# Altium schematic sheet Turret_Logic.SchDoc: PCB Projet Guimbarde Logic
size Letter; ApprovedBy: APPROUVÉ PAR; Author: Alexandre Dionne; Organization: Cegep Limoilou; Address1: 1300, 8e Avenue; Address2: Québec, QC; Address3: Canada; Address4: G1J 5L5; Revision: A; SheetNumber: 3; SheetTotal: 3
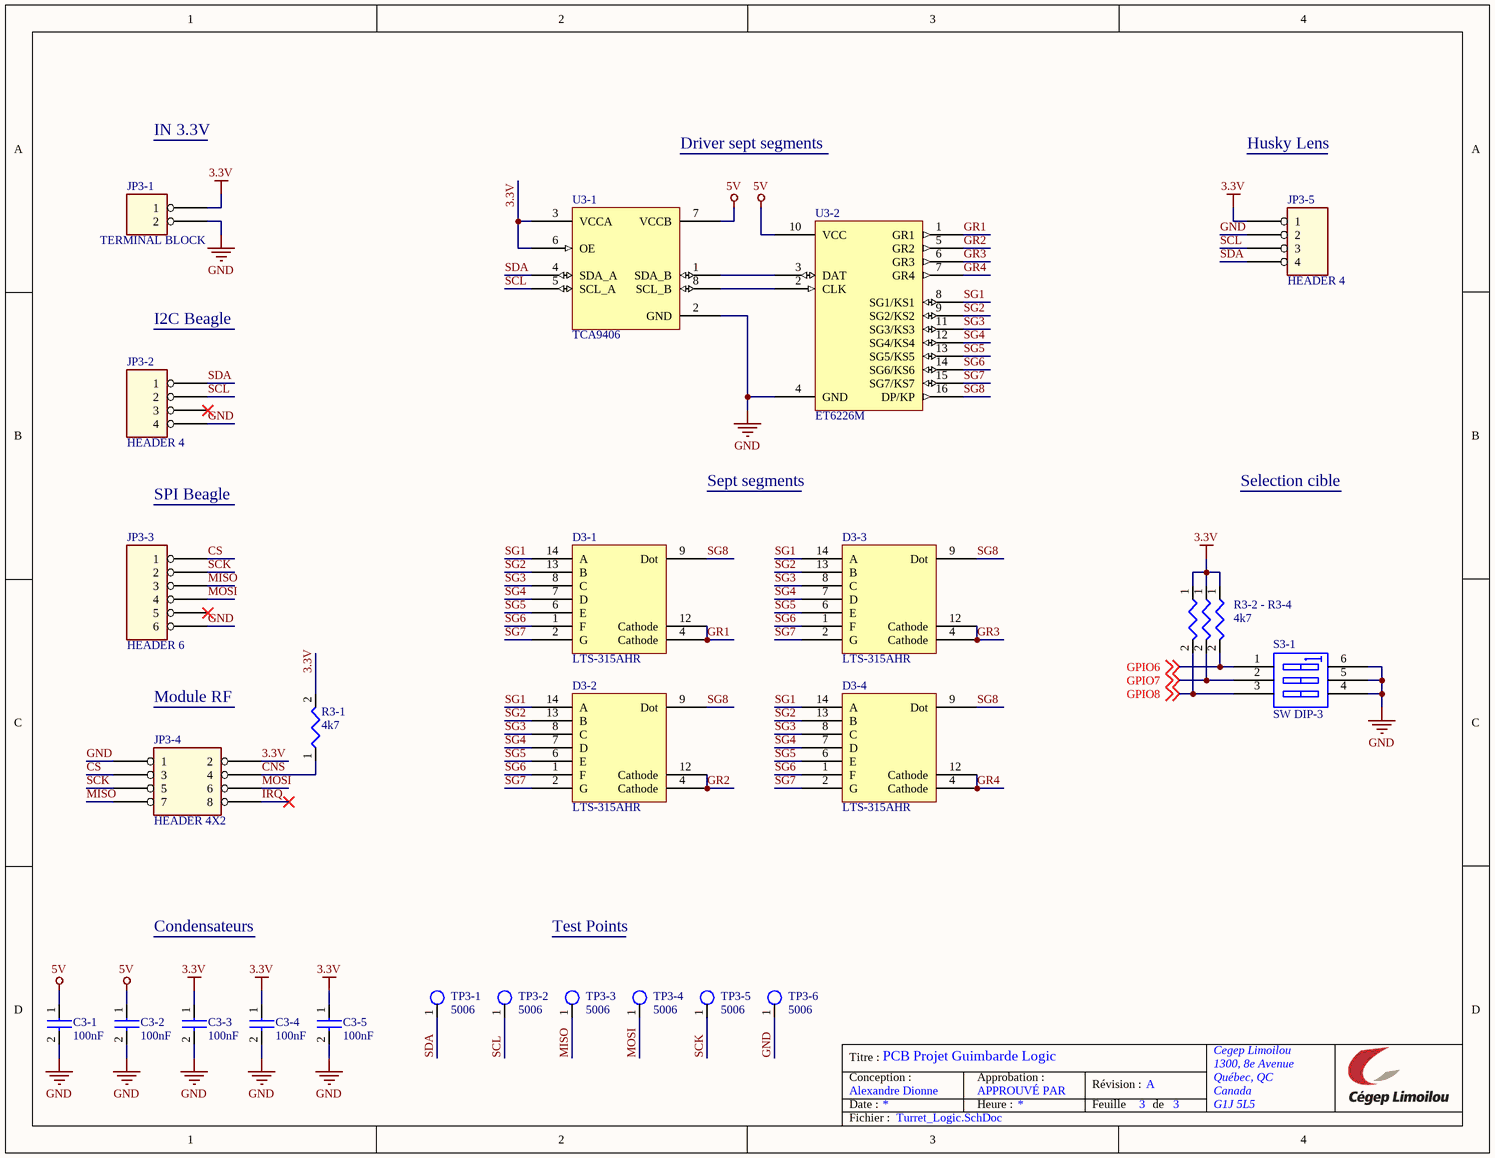
[diagram p0: Turret_Logic.SchDoc]

## Parts
C3-1  100nF  [CAP_0603]
C3-2  100nF  [CAP_0603]
C3-3  100nF  [CAP_0603]
C3-4  100nF  [CAP_0603]
C3-5  100nF  [CAP_0603]
D3-1  LTS-315AHR  [LTS-315AHR]
D3-2  LTS-315AHR  [LTS-315AHR]
D3-3  LTS-315AHR  [LTS-315AHR]
D3-4  LTS-315AHR  [LTS-315AHR]
JP3-1  TERMINAL BLOCK  [TB005-762-02BE]
JP3-2  HEADER 4  [Header_4]
JP3-3  HEADER 6  [Header_6]
JP3-4  HEADER 4X2  [Header_2x4]
JP3-5  HEADER 4  [Header_4]
R3-1  4k7  [RES_0603]
R3-2  4k7  [RES_0603]  (value not drawn)
R3-3  4k7  [RES_0603]  (value not drawn)
R3-4  4k7  [RES_0603]  (value not drawn)
S3-1  SW DIP-3  [219-3LPST]
TP3-1  5006  [TestPoint]
TP3-2  5006  [TestPoint]
TP3-3  5006  [TestPoint]
TP3-4  5006  [TestPoint]
TP3-5  5006  [TestPoint]
TP3-6  5006  [TestPoint]
U3-1  TCA9406  [TCA9406]
U3-2  ET6226M  [ET6226M]

## Nets
3.3V: C3-3.1 C3-4.1 C3-5.1 JP3-1.1 JP3-4.2 JP3-5.1 R3-1.2 R3-2.1 R3-3.1 R3-4.1 U3-1.3(VCCA) U3-1.6(OE)
5V: C3-1.1 C3-2.1 U3-1.7(VCCB) U3-2.10(VCC)
GND: C3-1.2 C3-2.2 C3-3.2 C3-4.2 C3-5.2 JP3-1.2 JP3-2.4 JP3-3.6 JP3-4.1 JP3-5.2 S3-1.4(B3) S3-1.5(B2) S3-1.6(B1) TP3-6.1 U3-1.2(GND) U3-2.4(GND)
CNS: JP3-4.4 R3-1.1
CS: JP3-3.1 JP3-4.3
GPIO6: R3-4.2 S3-1.1(A1) ; off-sheet GPIO6
GPIO7: R3-3.2 S3-1.2(A2) ; off-sheet GPIO7
GPIO8: R3-2.2 S3-1.3(A3) ; off-sheet GPIO8
GR1: D3-1.4(Cathode) D3-1.12(Cathode) U3-2.1(GR1)
GR2: D3-2.4(Cathode) D3-2.12(Cathode) U3-2.5(GR2)
GR3: D3-3.4(Cathode) D3-3.12(Cathode) U3-2.6(GR3)
GR4: D3-4.4(Cathode) D3-4.12(Cathode) U3-2.7(GR4)
IRQ: JP3-4.8
MISO: JP3-3.3 JP3-4.7 TP3-3.1
MOSI: JP3-3.4 JP3-4.6 TP3-4.1
SCK: JP3-3.2 JP3-4.5 TP3-5.1
SCL: JP3-2.2 JP3-5.3 TP3-2.1 U3-1.5(SCL_A)
SDA: JP3-2.1 JP3-5.4 TP3-1.1 U3-1.4(SDA_A)
SG1: D3-1.14(A) D3-2.14(A) D3-3.14(A) D3-4.14(A) U3-2.8(SG1/KS1)
SG2: D3-1.13(B) D3-2.13(B) D3-3.13(B) D3-4.13(B) U3-2.9(SG2/KS2)
SG3: D3-1.8(C) D3-2.8(C) D3-3.8(C) D3-4.8(C) U3-2.11(SG3/KS3)
SG4: D3-1.7(D) D3-2.7(D) D3-3.7(D) D3-4.7(D) U3-2.12(SG4/KS4)
SG5: D3-1.6(E) D3-2.6(E) D3-3.6(E) D3-4.6(E) U3-2.13(SG5/KS5)
SG6: D3-1.1(F) D3-2.1(F) D3-3.1(F) D3-4.1(F) U3-2.14(SG6/KS6)
SG7: D3-1.2(G) D3-2.2(G) D3-3.2(G) D3-4.2(G) U3-2.15(SG7/KS7)
SG8: D3-1.9(Dot) D3-2.9(Dot) D3-3.9(Dot) D3-4.9(Dot) U3-2.16(DP/KP)
NetU3-1_1: U3-1.1(SDA_B) U3-2.3(DAT)
NetU3-1_8: U3-1.8(SCL_B) U3-2.2(CLK)

Not connected (* = marked no-connect by the designer): JP3-2 3*; JP3-3 5*

## Notes on the sheet
- IN 3.3V
- Driver sept segments
- Husky Lens
- I2C Beagle
- SPI Beagle
- Sept segments
- Selection cible
- (near R3-4) 4k7
- (near R3-4) R3-2 - R3-4
- Module RF
- Condensateurs
- Test Points
- Titre :
- Conception :
- Date :
- Approbation :
- Heure :
- Révision :
- Feuille
- de
- Fichier :

## Library data of the parts
C3-1-C3-5 = CAP NP
JP3-1 = HEADER 2
R3-1-R3-4 = R
TP3-1-TP3-6 = Test_Point